# Altium schematic sheet MAIN.SchDoc
size A4; SheetNumber: 1; SheetTotal: 6
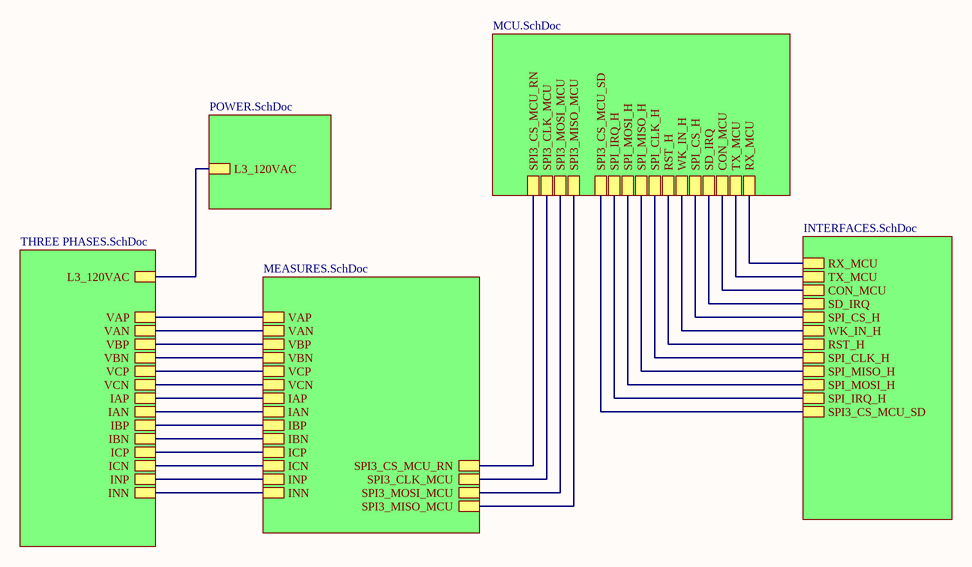
[diagram p0: MAIN.SchDoc]

## Sub-sheets
Designator = MEASURES.SchDoc: VAP, VAN, VBP, VBN, VCP, VCN, IAP, IAN, IBP, IBN, ICP, ICN, INP, INN, SPI3_MISO_MCU, SPI3_MOSI_MCU, SPI3_CLK_MCU, SPI3_CS_MCU_RN
Designator = POWER.SchDoc: L3_120VAC
Designator = THREE PHASES.SchDoc: VAP, VAN, VBP, VBN, VCP, VCN, IAP, IAN, IBP, IBN, ICP, ICN, INP, INN, L3_120VAC
Designator = MCU.SchDoc: SPI_IRQ_H, SPI_MOSI_H, SPI_MISO_H, SPI_CLK_H, RST_H, WK_IN_H, SPI_CS_H, CON_MCU, TX_MCU, RX_MCU, SPI3_CLK_MCU, SPI3_MOSI_MCU, SPI3_MISO_MCU, SD_IRQ, SPI3_CS_MCU_SD, SPI3_CS_MCU_RN
Designator = INTERFACES.SchDoc: TX_MCU, CON_MCU, RX_MCU, SPI_CS_H, SPI_MISO_H, WK_IN_H, RST_H, SPI_CLK_H, SPI_MOSI_H, SPI_IRQ_H, SD_IRQ, SPI3_CS_MCU_SD

## Nets
(unnamed): sheet Designator/VAP, sheet Designator/VAP
(unnamed): sheet Designator/VAN, sheet Designator/VAN
(unnamed): sheet Designator/VBP, sheet Designator/VBP
(unnamed): sheet Designator/VBN, sheet Designator/VBN
(unnamed): sheet Designator/VCP, sheet Designator/VCP
(unnamed): sheet Designator/VCN, sheet Designator/VCN
(unnamed): sheet Designator/IAP, sheet Designator/IAP
(unnamed): sheet Designator/IAN, sheet Designator/IAN
(unnamed): sheet Designator/IBP, sheet Designator/IBP
(unnamed): sheet Designator/IBN, sheet Designator/IBN
(unnamed): sheet Designator/ICP, sheet Designator/ICP
(unnamed): sheet Designator/ICN, sheet Designator/ICN
(unnamed): sheet Designator/INP, sheet Designator/INP
(unnamed): sheet Designator/INN, sheet Designator/INN
(unnamed): sheet Designator/SPI3_MISO_MCU, sheet Designator/SPI3_MISO_MCU
(unnamed): sheet Designator/SPI3_MOSI_MCU, sheet Designator/SPI3_MOSI_MCU
(unnamed): sheet Designator/SPI3_CLK_MCU, sheet Designator/SPI3_CLK_MCU
(unnamed): sheet Designator/SPI3_CS_MCU_RN, sheet Designator/SPI3_CS_MCU_RN
(unnamed): sheet Designator/L3_120VAC, sheet Designator/L3_120VAC
(unnamed): sheet Designator/SPI_IRQ_H, sheet Designator/SPI_IRQ_H
(unnamed): sheet Designator/SPI_MOSI_H, sheet Designator/SPI_MOSI_H
(unnamed): sheet Designator/SPI_MISO_H, sheet Designator/SPI_MISO_H
(unnamed): sheet Designator/SPI_CLK_H, sheet Designator/SPI_CLK_H
(unnamed): sheet Designator/RST_H, sheet Designator/RST_H
(unnamed): sheet Designator/WK_IN_H, sheet Designator/WK_IN_H
(unnamed): sheet Designator/SPI_CS_H, sheet Designator/SPI_CS_H
(unnamed): sheet Designator/CON_MCU, sheet Designator/CON_MCU
(unnamed): sheet Designator/TX_MCU, sheet Designator/TX_MCU
(unnamed): sheet Designator/RX_MCU, sheet Designator/RX_MCU
(unnamed): sheet Designator/SD_IRQ, sheet Designator/SD_IRQ
(unnamed): sheet Designator/SPI3_CS_MCU_SD, sheet Designator/SPI3_CS_MCU_SD